# EasyEDA Pro project curtain-lifter.epro, schematic Curtain_Lifter_Mainboard

## Sheets
1 01_Power_Input: Board Name: Curtain_Lifter_Mainboard_RevA; Create Date: 2026-10-13; Page Name: 01_Power_Input; Project Name: 涂鸦智能家居产品-窗帘开关; Schematic Name: Curtain_Lifter_Mainboard; Update Date: 2026-10-13; Company: 嘉立创EDA; Page Size: A4; Version: V1.0
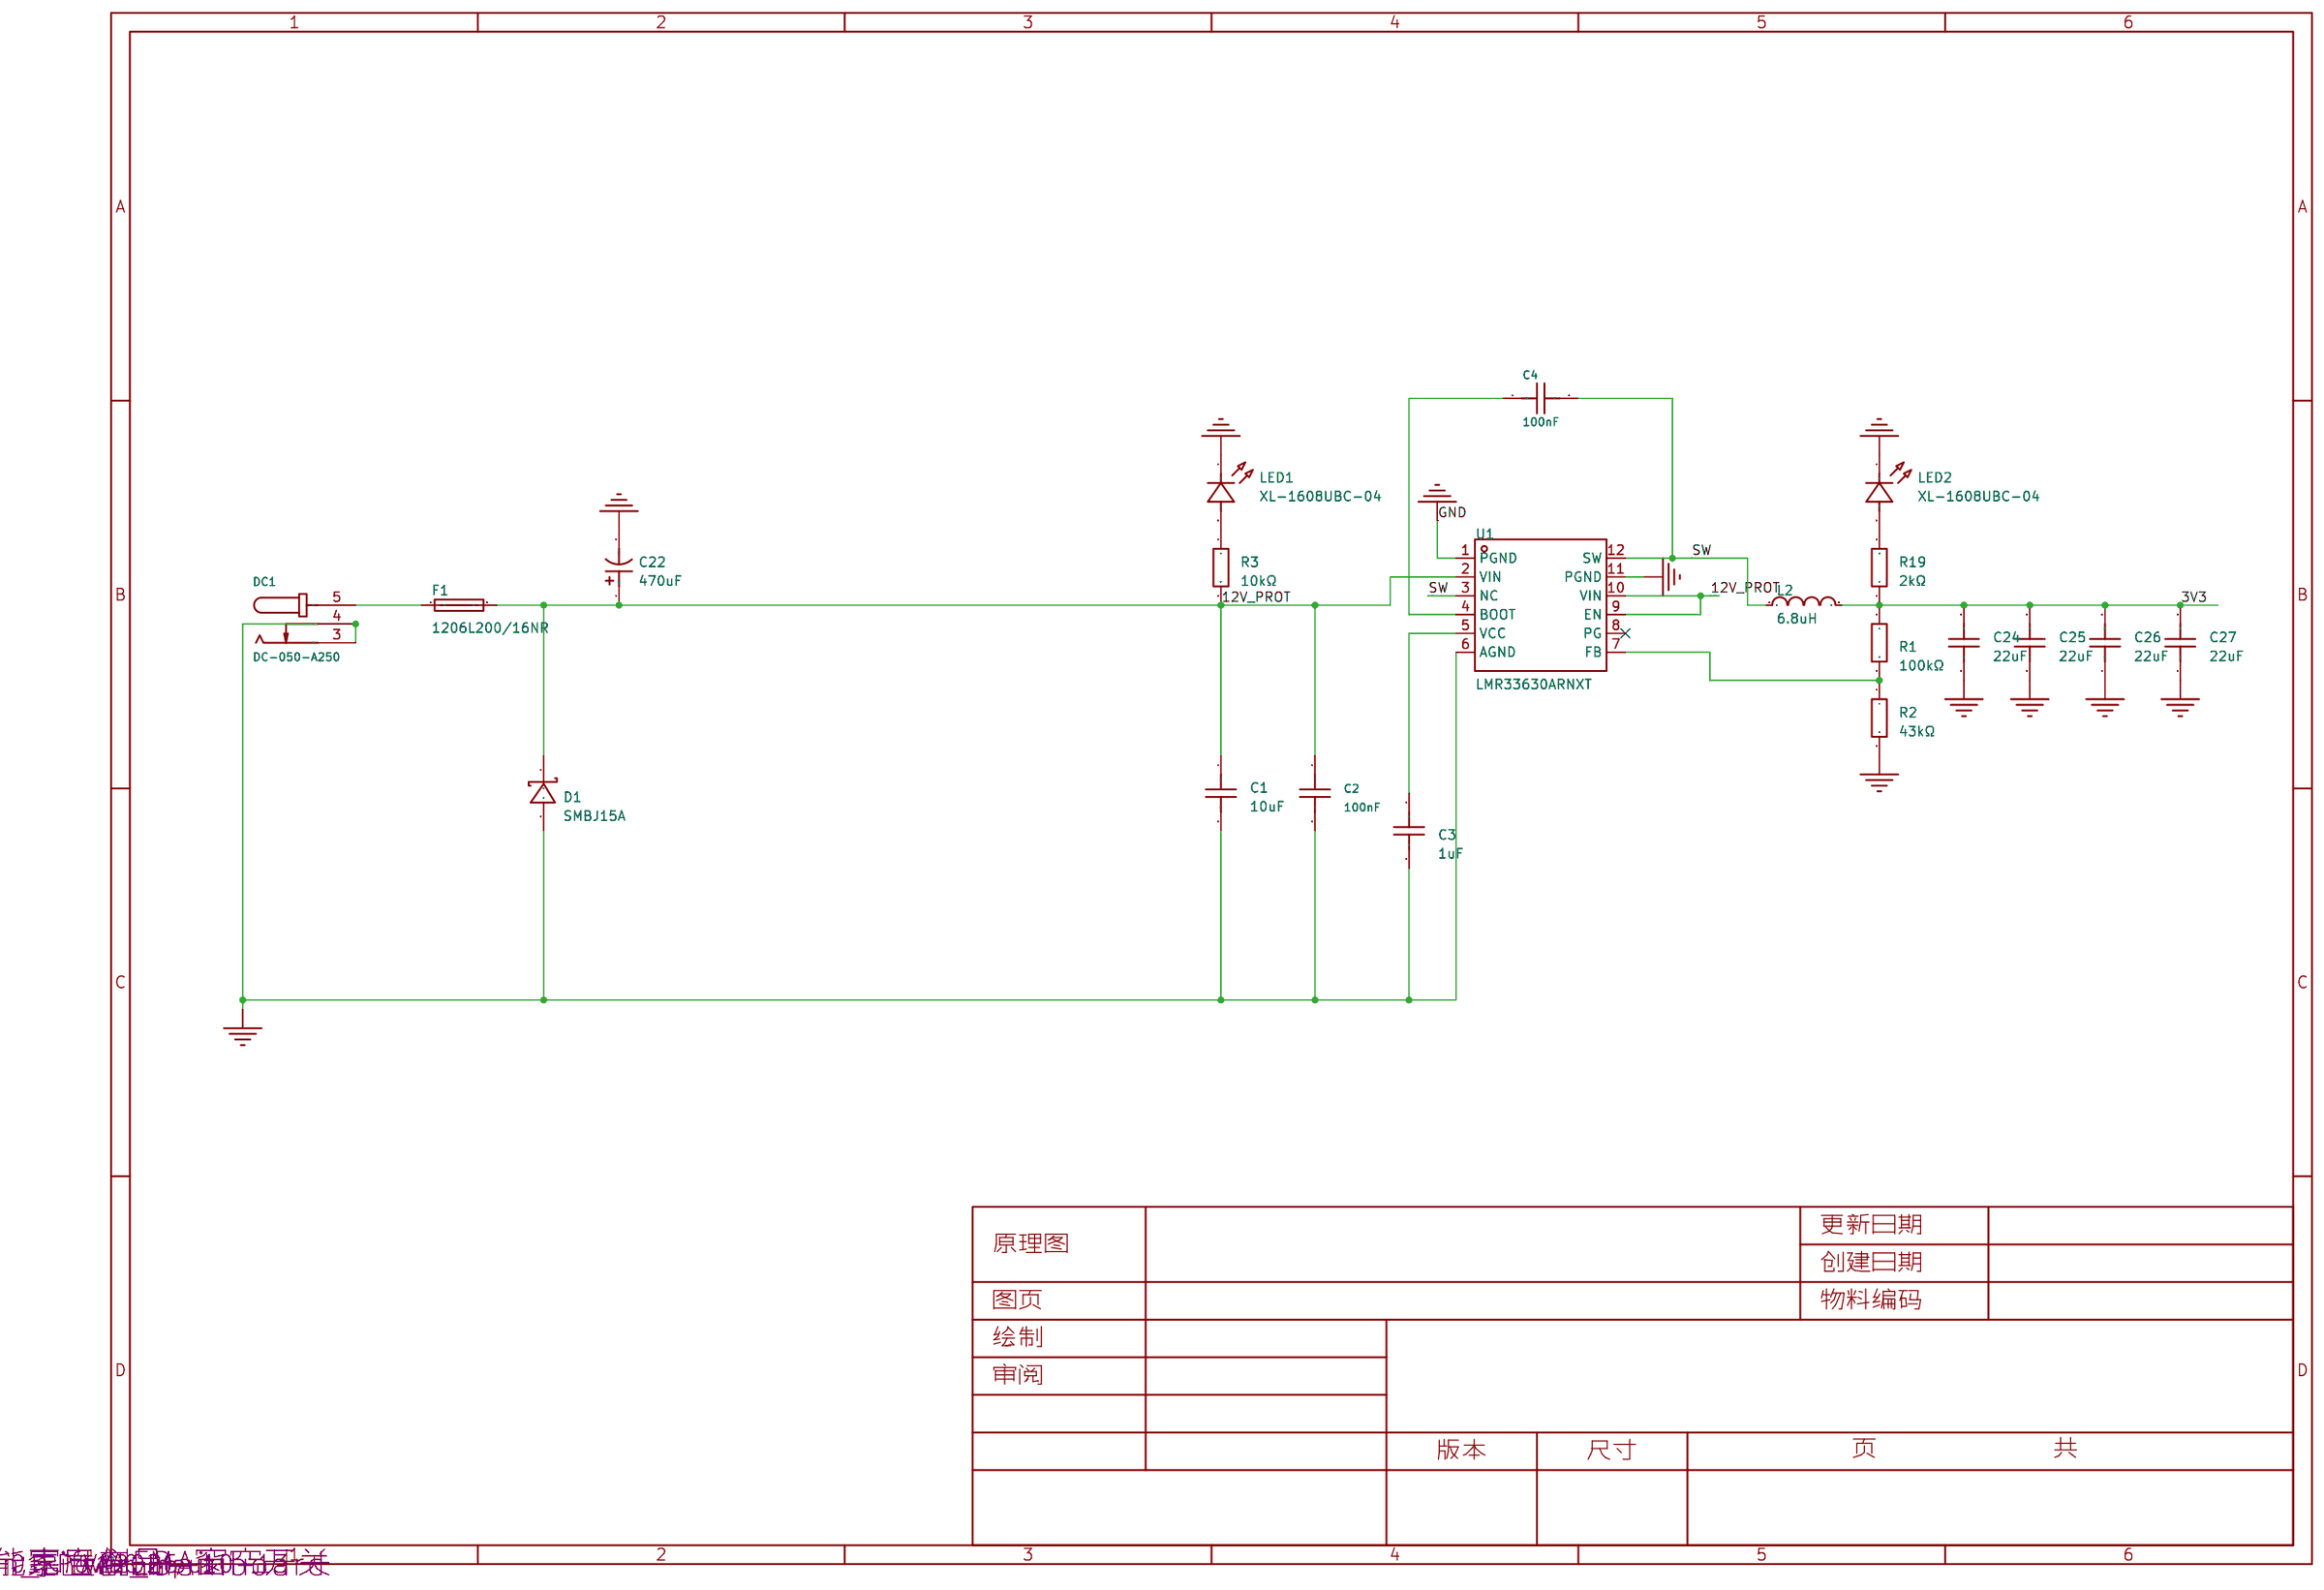
[diagram p1: 01_Power_Input]
2 02_Stepper_Driver: Create Date: 2026-10-25; Page Name: 02_Stepper_Driver; Update Date: 2026-10-25
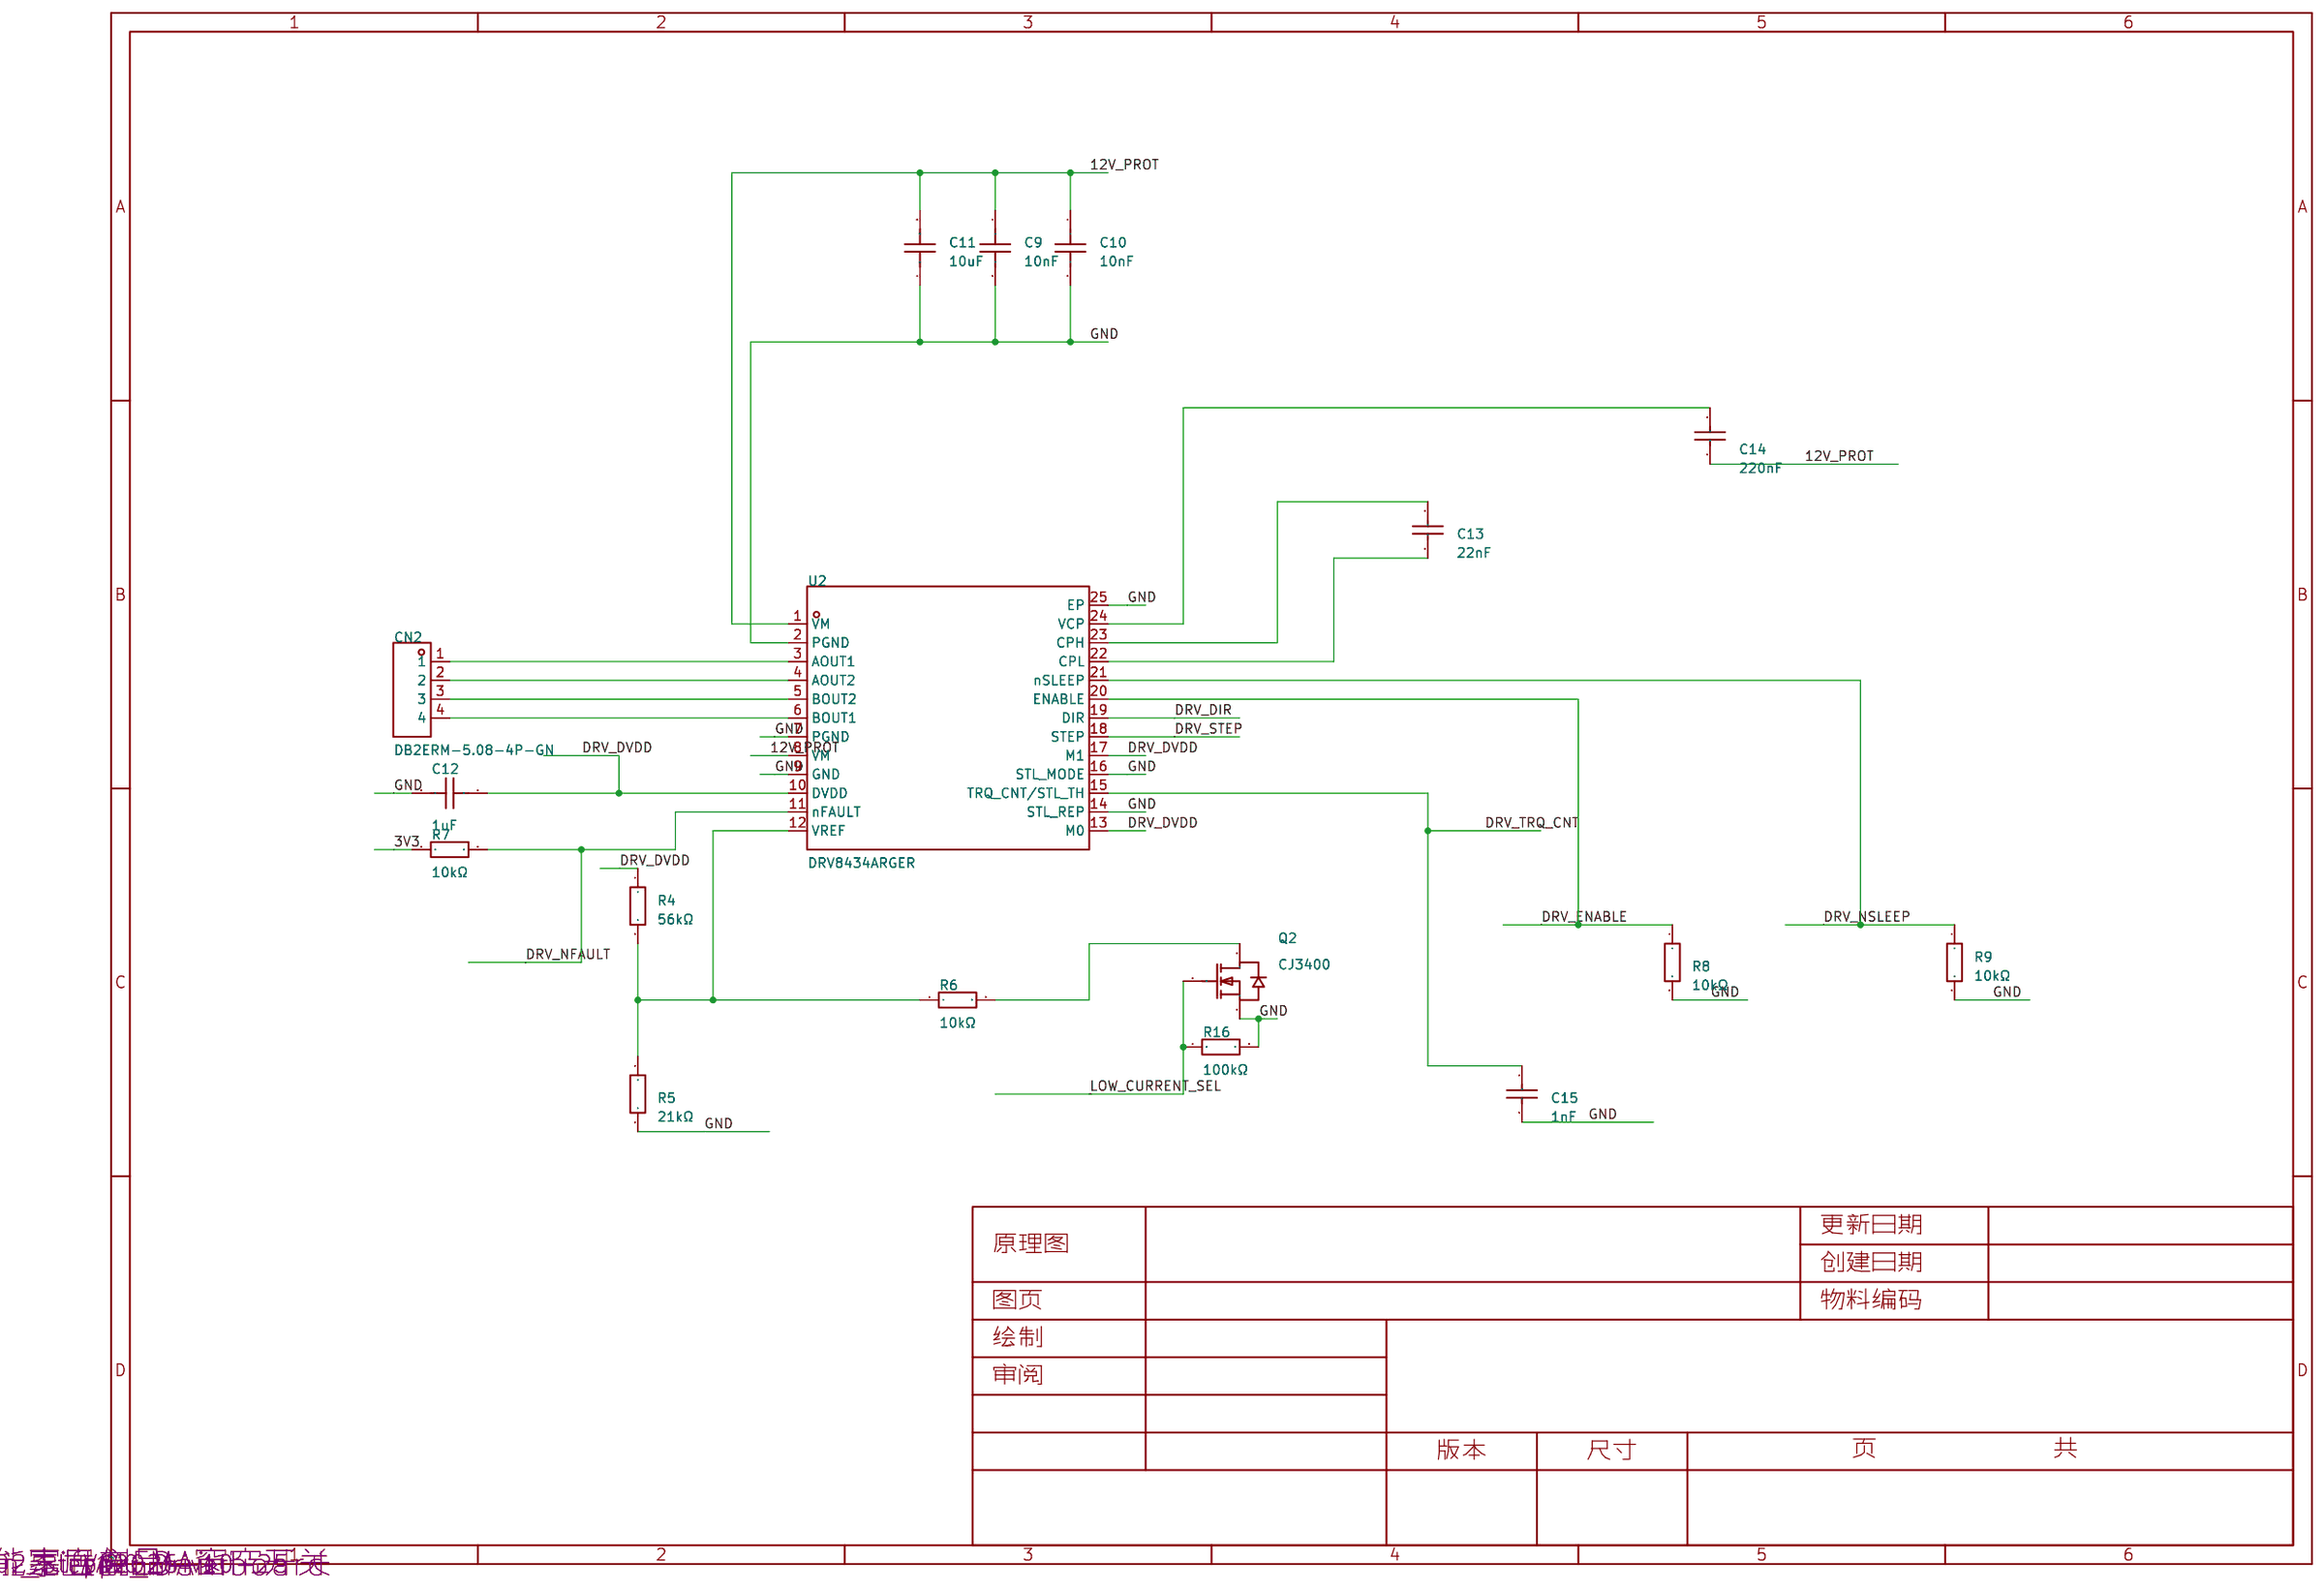
[diagram p2: 02_Stepper_Driver]
3 03_MCU_Control: Page Name: 03_MCU_Control
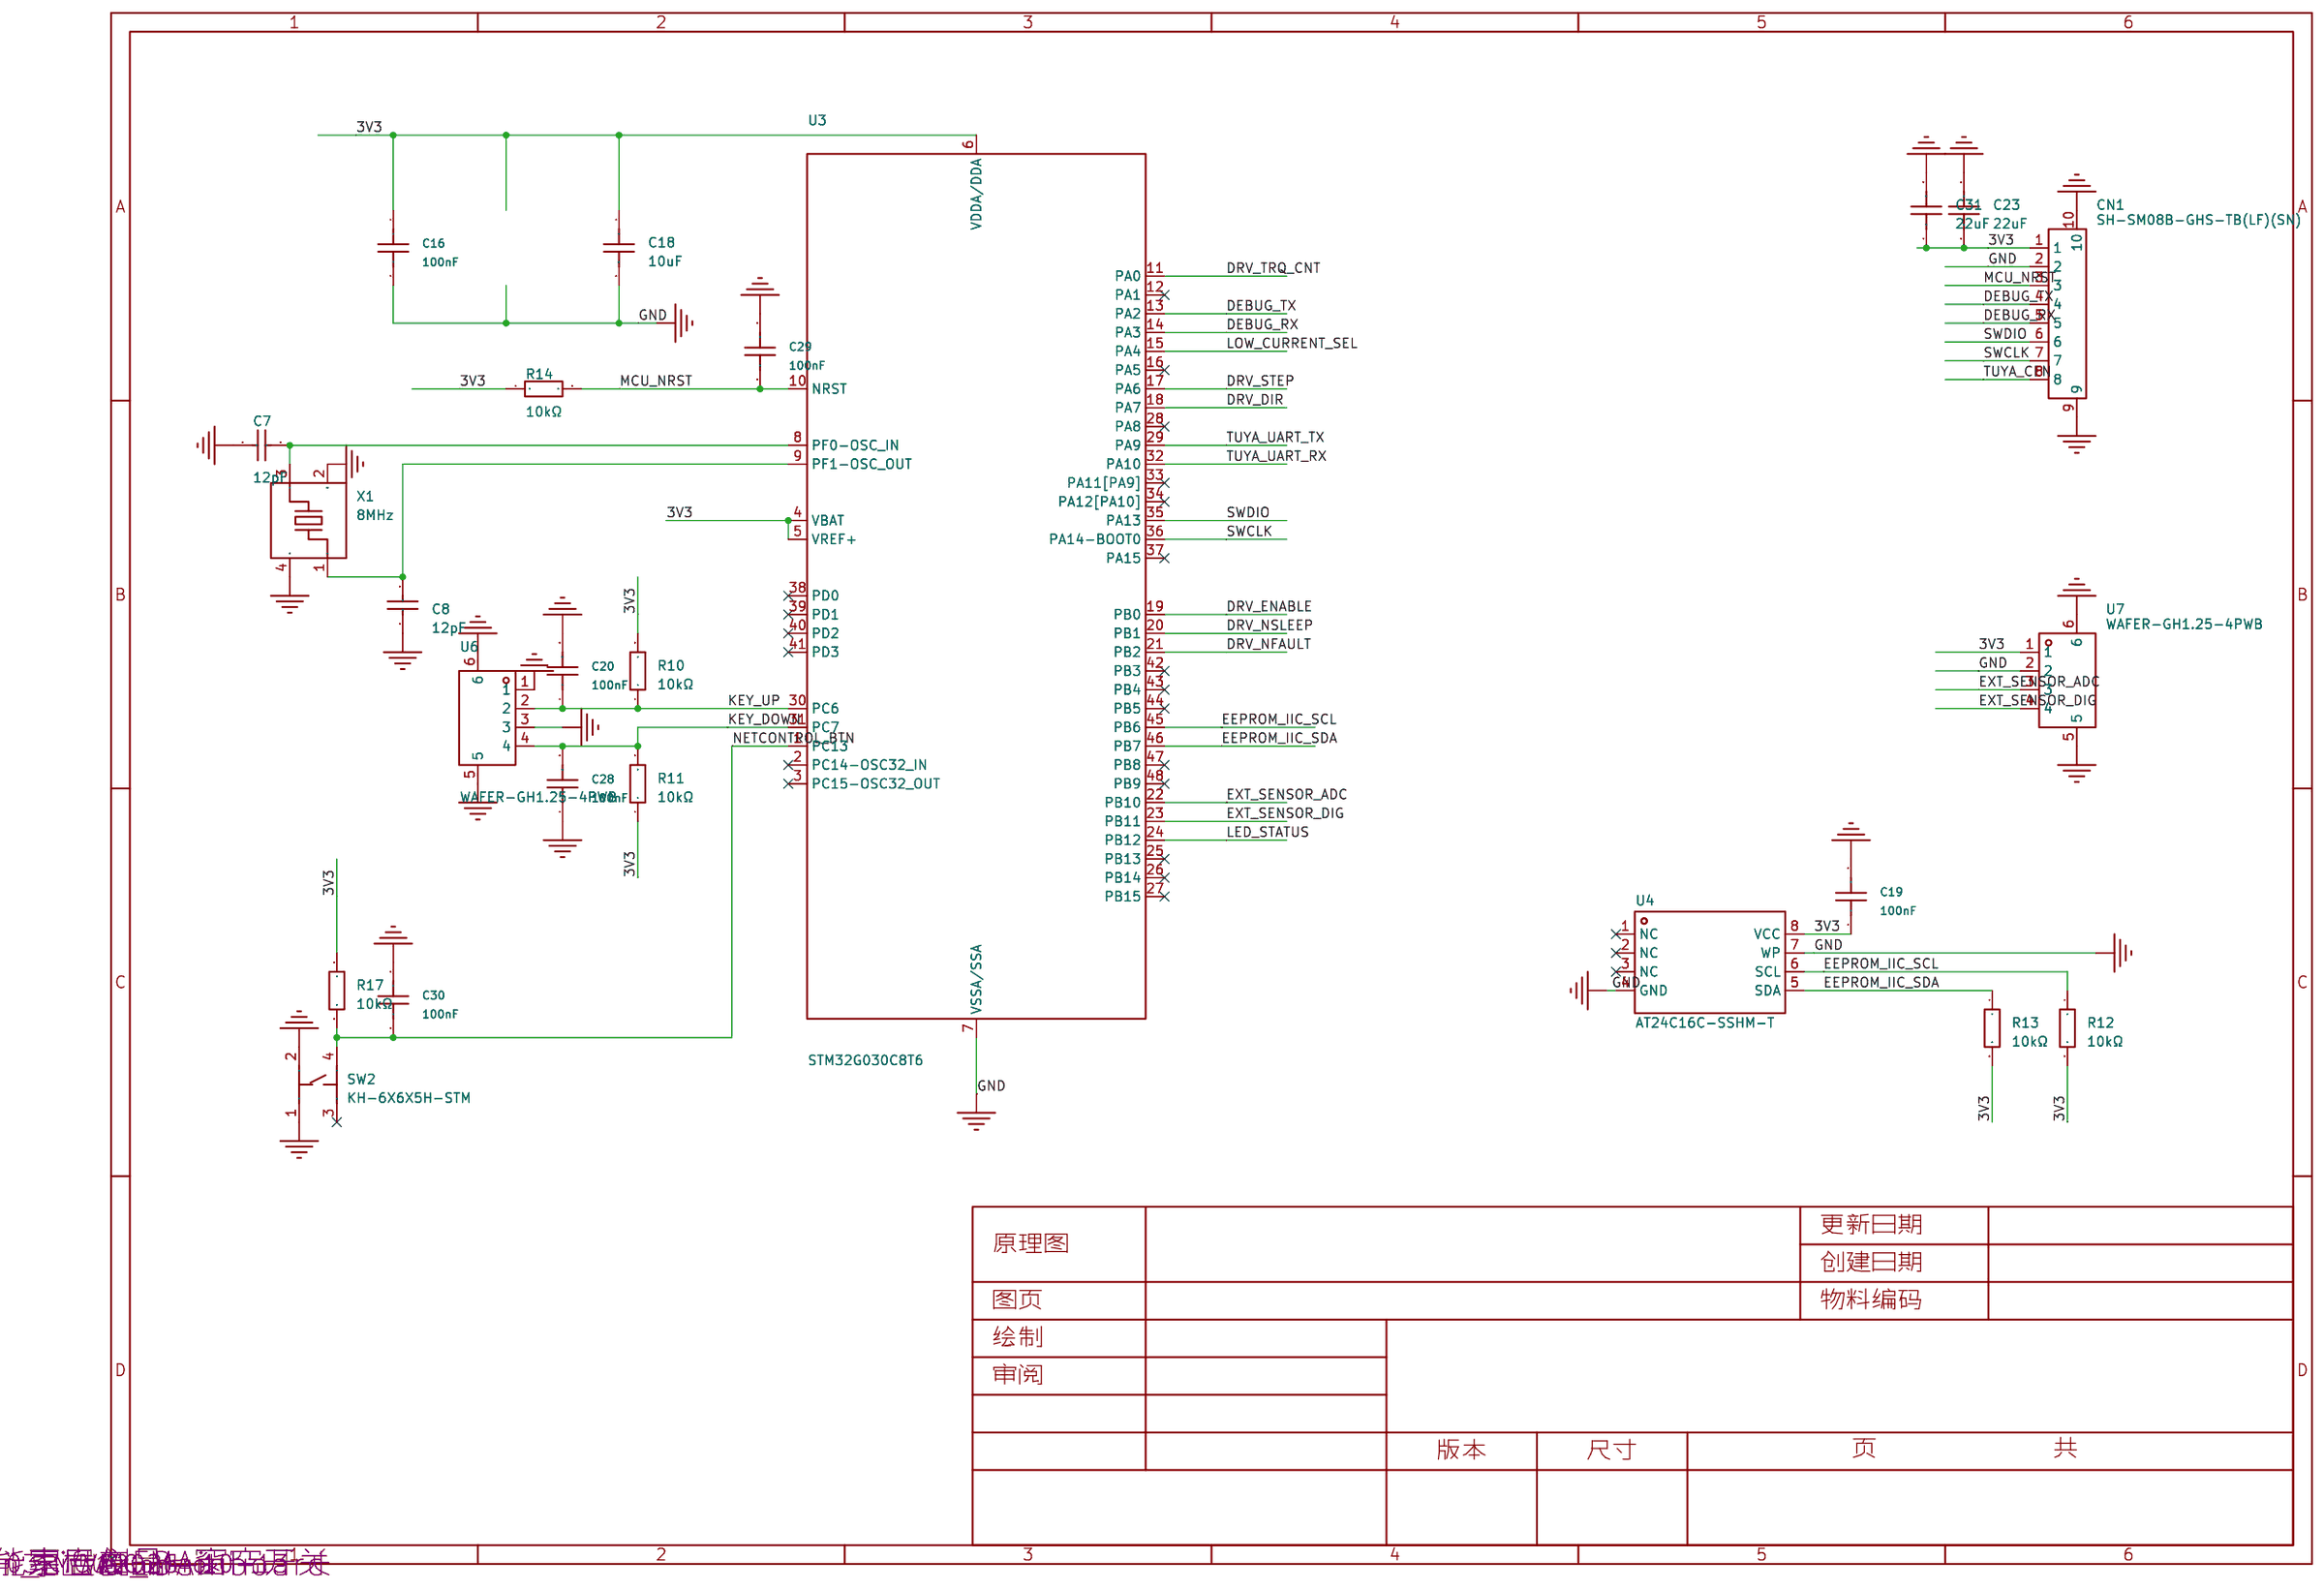
[diagram p3: 03_MCU_Control]
4 04_Wireless_UI: Create Date: 2026-10-25; Page Name: 04_Wireless_UI; Update Date: 2026-10-25
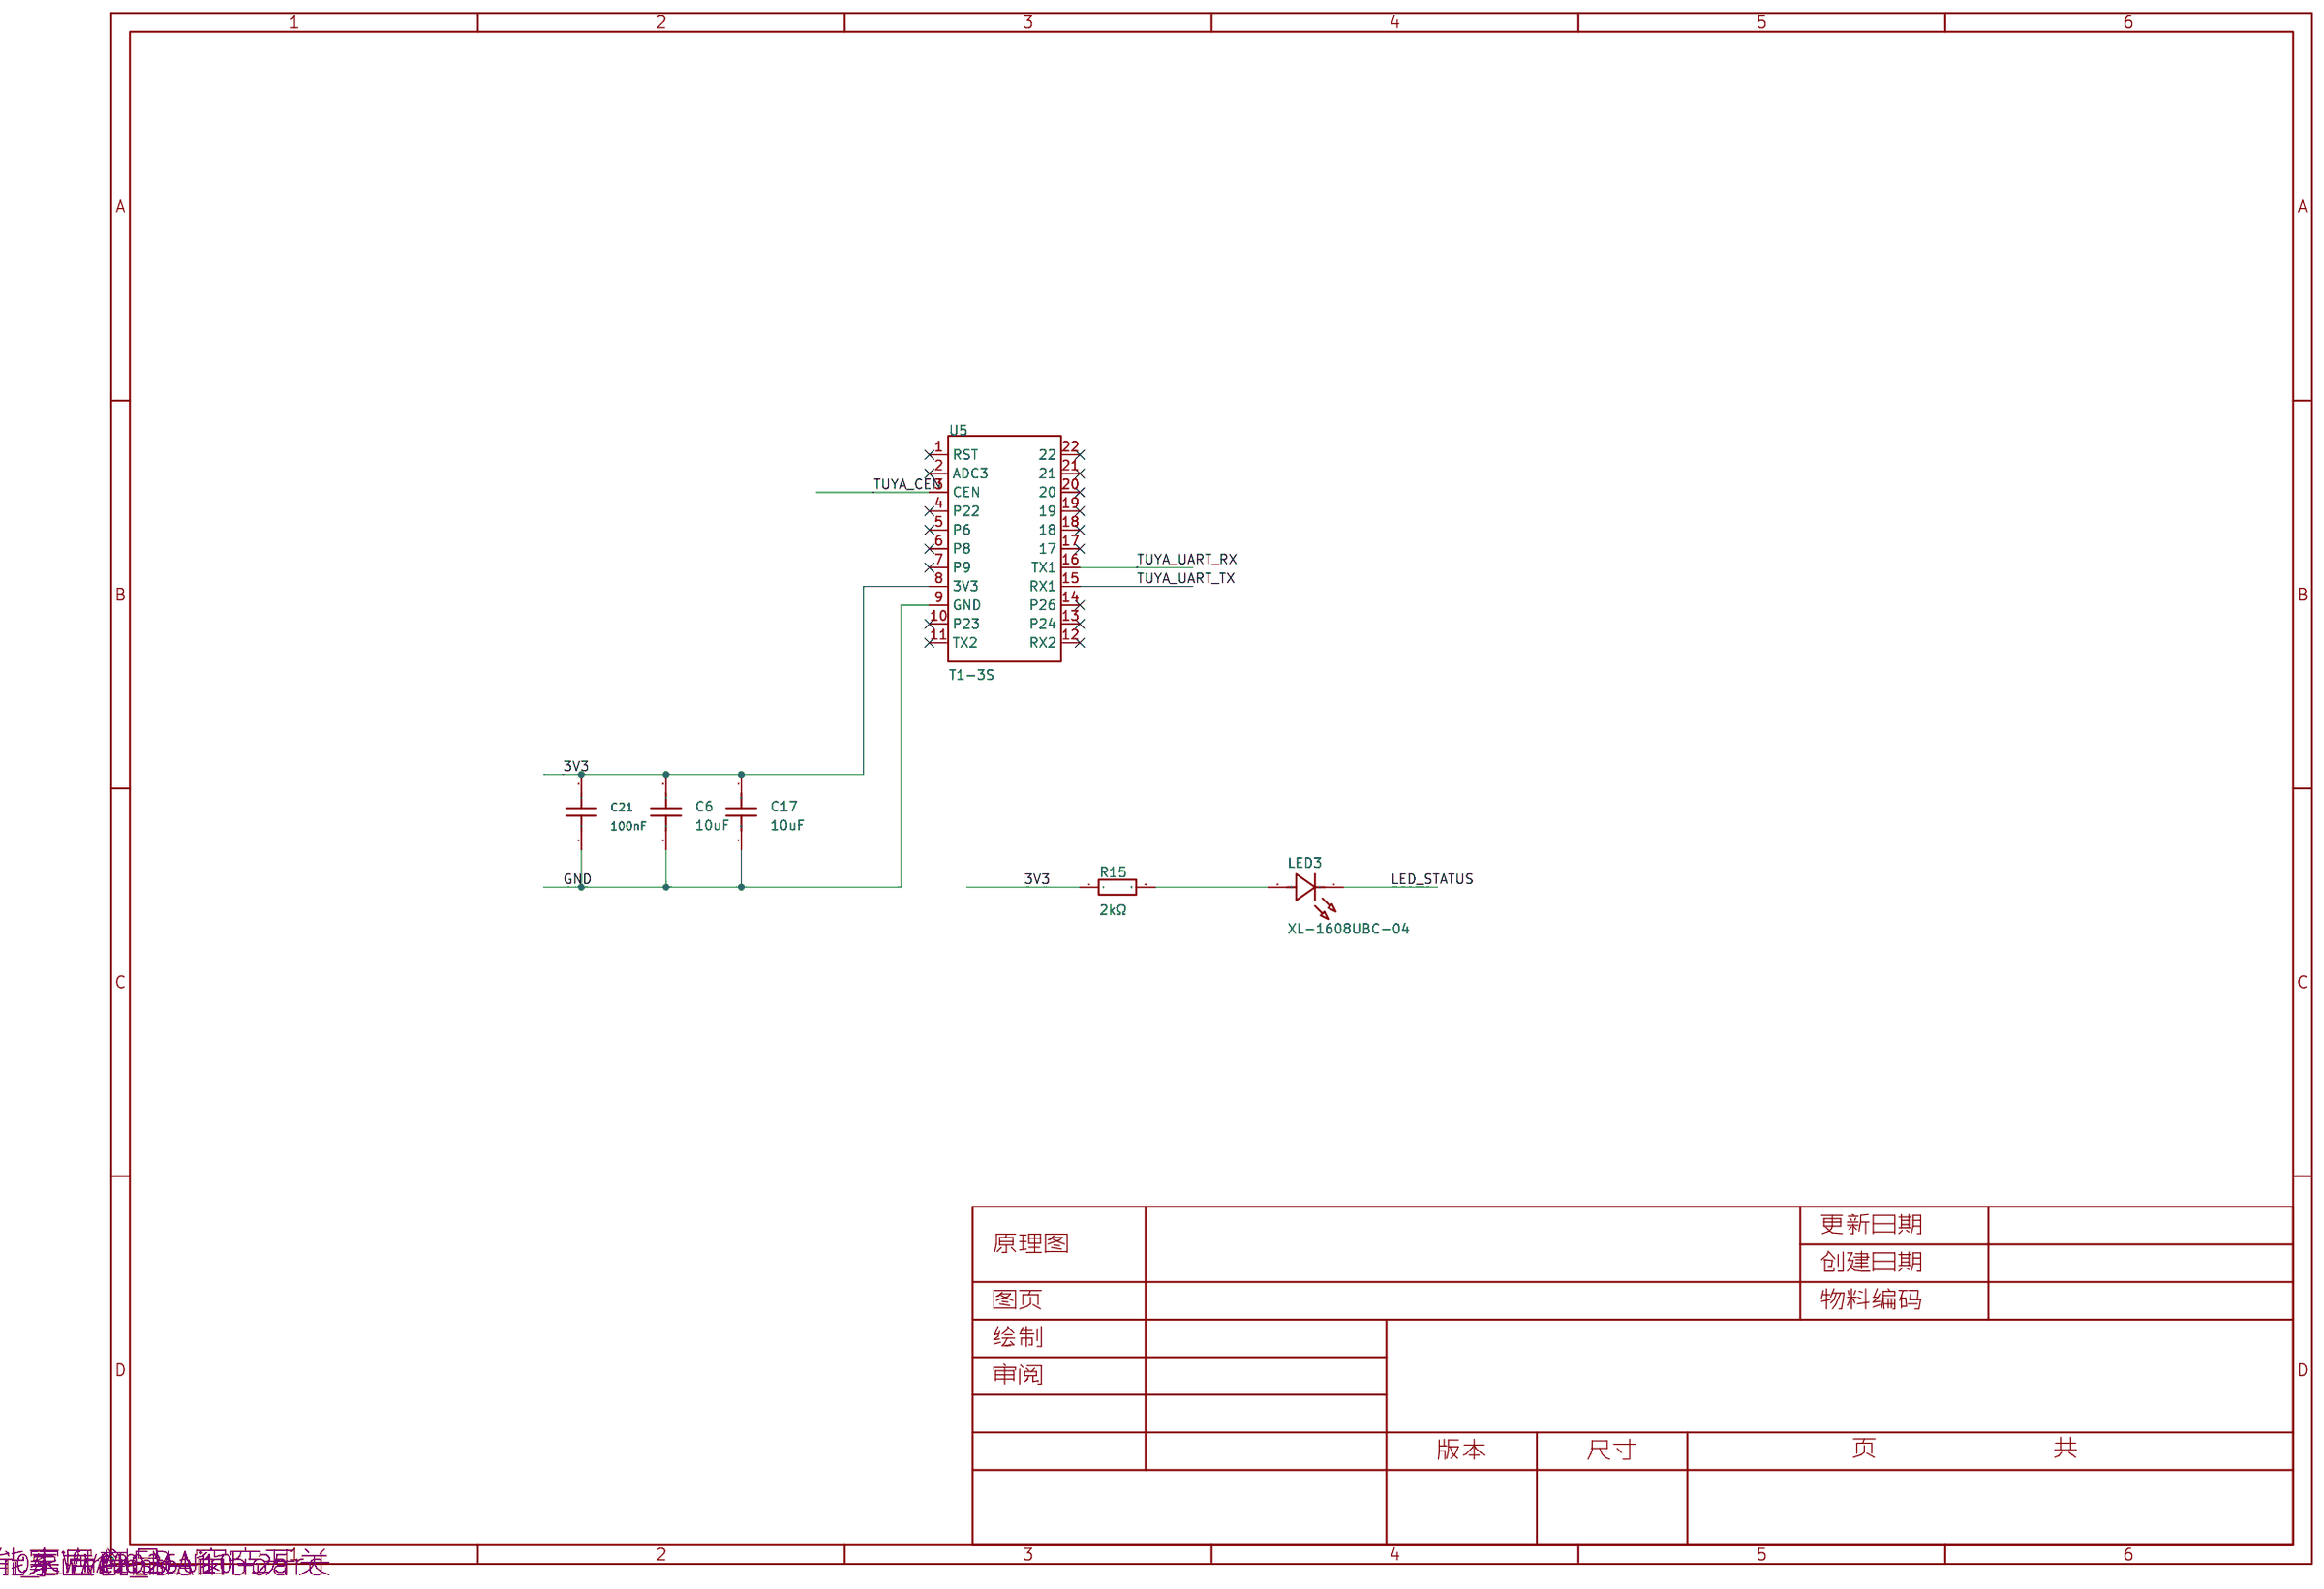
[diagram p4: 04_Wireless_UI]

## Parts
sheet 01_Power_Input
C1  10uF  [C1206]
C2  100nF  [C0603]
C3  1uF  [C0603]
C4  100nF  [C0603]
C22  470uF  [CAP-SMD_BD10.0-L10.3-W10.3-LS11.0]
C24  22uF  [C1206]
C25  22uF  [C1206]
C26  22uF  [C1206]
C27  22uF  [C1206]
D1  SMBJ15A  [SMB_L4.6-W3.6-LS5.3-RD]
DC1  DC-050-A250  [DC-IN-SMD_DC-050-A200]
F1  1206L200/16NR  [F1206]
L2  6.8uH  [IND-SMD_L11.0-W10.0_MDA1054HT]
LED1  XL-1608UBC-04  [LED0603-RD_BLUE]
LED2  XL-1608UBC-04  [LED0603-RD_BLUE]
R1  100kΩ  [R0603]
R2  43kΩ  [R0603]
R3  10kΩ  [R0603]
R19  2kΩ  [R0603]
U1  LMR33630ARNXT  [VQFN-12_L3.0-W2.0-P0.65-BL_TI_LMR33630XRNXT]
sheet 02_Stepper_Driver
C9  10nF  [C0603]
C10  10nF  [C0603]
C11  10uF  [C1206]
C12  1uF  [C0603]
C13  22nF  [C0603]
C14  220nF  [C0603]
C15  1nF  [C0603]
CN2  DB2ERM-5.08-4P-GN  [CONN-TH_4P-P5.08_DB2ERM-5.08-4P]
Q2  CJ3400  [SOT-23_L2.9-W1.3-P1.90-LS2.4-BR]
R4  56kΩ  [R0603]
R5  21kΩ  [R0603]
R6  10kΩ  [R0603]
R7  10kΩ  [R0603]
R8  10kΩ  [R0603]
R9  10kΩ  [R0603]
R16  100kΩ  [R0603]
U2  DRV8434ARGER  [VQFN-24_L4.0-W4.0-P0.50-TL-EP2.5]
sheet 03_MCU_Control
C7  12pF  [C0603]
C8  12pF  [C0603]
C16  100nF  [C0603]
C18  10uF  [C0805]
C19  100nF  [C0603]
C20  100nF  [C0603]
C23  22uF  [C1206]
C28  100nF  [C0603]
C29  100nF  [C0603]
C30  100nF  [C0603]
C31  22uF  [C1206]
CN1  SH-SM08B-GHS-TB(LF)(SN)  [CONN-SMD_SH-SM08B-GHS-TB]
R10  10kΩ  [R0603]
R11  10kΩ  [R0603]
R12  10kΩ  [R0603]
R13  10kΩ  [R0603]
R14  10kΩ  [R0603]
R17  10kΩ  [R0603]
SW2  KH-6X6X5H-STM  [SW-SMD_4P-L6.0-W6.0-P4.50-LS9.0_H5.0]
U3  STM32G030C8T6  [LQFP-48_L7.0-W7.0-P0.50-LS9.0-BL_1]
U4  AT24C16C-SSHM-T  [SOIC-8_L4.9-W3.9-P1.27-LS6.0-BL]
U6  WAFER-GH1.25-4PWB  [CONN-SMD_4P-P1.25_XUNPU_WAFER-GH1.25-4PWB]
U7  WAFER-GH1.25-4PWB  [CONN-SMD_4P-P1.25_XUNPU_WAFER-GH1.25-4PWB]
X1  8MHz  [CRYSTAL-SMD_4P-L3.2-W2.5-BL]
sheet 04_Wireless_UI
C6  10uF  [C0805]
C17  10uF  [C0805]
C21  100nF  [C0603]
LED3  XL-1608UBC-04  [LED0603-RD_BLUE]
R15  2kΩ  [R0603]
U5  T1-3S  [WIFIM-SMD_22P-L24.0-W16.0-P2.00_TI-3S]

## Library data of the parts
C1 C11 = HGC1206R7106K500NSPJ: 容值:10uF;精度:±10%;额定电压:50V;温度系数:X7R;; LCSC Part Name: 10uF ±10% 50V; Supplier Part: C33546013; Manufacturer: Chinocera(华瓷); Supplier Footprint: 1206; JLCPCB Part Class: Extended Part; Datasheet: https://item.szlcsc.com/datasheet/HGC1206R7106K500NSPJ/35278491.html; Supplier: LCSC; Tolerance: ±10%; Voltage Rating: 50V; Temperature Coefficient: X7R
C2 C4 C16 C19-C21 C28-C30 = CC0603KRX7R9BB104: 容值:100nF;精度:±10%;额定电压:50V;温度系数:X7R;; LCSC Part Name: 100nF ±10% 50V; Supplier Part: C14663; Manufacturer: YAGEO(国巨); Supplier Footprint: 0603; JLCPCB Part Class: Basic Part; Datasheet: https://item.szlcsc.com/datasheet/CC0603KRX7R9BB104/15331.html; Supplier: LCSC; Tolerance: ±10%; Voltage Rating: 50V; Temperature Coefficient: X7R; supplier: LCSC; supplierId: C14663
C3 C12 = CL10A105KB8NNNC: 容值:1uF;精度:±10%;额定电压:50V;温度系数:X5R;; LCSC Part Name: 1uF ±10% 50V; Supplier Part: C15849; Manufacturer: SAMSUNG(三星); Supplier Footprint: 0603; JLCPCB Part Class: Basic Part; Datasheet: https://item.szlcsc.com/datasheet/CL10A105KB8NNNC/16531.html; Supplier: LCSC; Tolerance: ±10%; Voltage Rating: 50V; Temperature Coefficient: X5R; supplier: LCSC; supplierId: C15849
C22 = JVJ35V470M10x10: 容值:470uF;精度:±20%;额定电压:35V;纹波电流:320mA@120Hz;; LCSC Part Name: 470uF ±20% 35V; Supplier Part: C46550413; Manufacturer: JIERR(捷而瑞); Supplier Footprint: SMD,D10xL10.5mm; JLCPCB Part Class: Extended Part; Datasheet: https://item.szlcsc.com/datasheet/JVJ35V470M10x10/48680107.html; Supplier: LCSC; Tolerance: ±20%; Voltage Rating: 35V; Ripple Current: 320mA@120Hz; Diameter: 10mm; Height - Seated (Max): 10.5mm; Lifetime: 2000hrs@105℃; Operating Temperature: -55℃~+105℃
C23-C27 C31 = FCC1206X226K160HT: 容值:22uF;精度:±10%;额定电压:16V;温度系数:X5R;; LCSC Part Name: 22uF ±10% 16V; Supplier Part: C5137635; Manufacturer: FOJAN(富捷); Supplier Footprint: 1206; JLCPCB Part Class: Extended Part; Datasheet: https://item.szlcsc.com/datasheet/FCC1206X226K160HT/5747087.html; Supplier: LCSC; Tolerance: ±10%; Voltage Rating: 16V; Temperature Coefficient: X5R; Operating Temperature: -55℃~+85℃
D1 = SMBJ15A: 极性:单向;反向截止电压(Vrwm):15V;钳位电压:24.4V;峰值脉冲电流(Ipp):24.59A;峰值脉冲功率(Ppp):600W@10/1000us;击穿电压(VBR):16.7V;; LCSC Part Name: 单向TVS 15V截止 峰值浪涌电流：24.59A; Supplier Part: C357961; Manufacturer: DOWO(东沃); Supplier Footprint: SMB(DO-214AA); JLCPCB Part Class: Extended Part; Datasheet: https://item.szlcsc.com/datasheet/SMBJ15A/333045.html; Supplier: LCSC; Polarity: 单向; Reverse Stand-Off Voltage (Vrwm): 15V; Clamping Voltage: 24.4V; Peak Pulse Current (Ipp): 24.59A; Peak Pulse Power Dissipation (Ppp): 600W@10/1000us; Voltage - Breakdown: 16.7V; Reverse Leakage Current (Ir): 1uA; Number of Channels: 单路; Operating Temperature: -55℃~+150℃; Type: TVS; supplier: LCSC; supplierId: C357961
DC1 = DC-050-A250: 连接器类型:DC电源插座;安装方式:卧贴;触点内径:2.5mm;触点外径:6.4mm;额定电流:1A;额定电压:12V;工作温度:-30℃~+70℃;; LCSC Part Name: DC电源插座 内径:2.5mm 外径:6.4mm; Supplier Part: C41429013; Manufacturer: XUNPU(讯普); Supplier Footprint: SMD; JLCPCB Part Class: Extended Part; Datasheet: https://item.szlcsc.com/datasheet/DC-050-A250/43280632.html; Supplier: LCSC; Connector Type: DC电源插座; Mounting Type: 卧贴; Inside Contact Diameter: 2.5mm; Outside Contact Diameter: 6.4mm; Current Rating: 1A; Voltage Rating (Max): 12V; Body Height: 11mm; Length: 14.7mm; Width: 12.7mm; Operating Temperature: -30℃~+70℃
F1 = 1206L200/16NR: 耐压(Vmax):16V;最大电流(Imax):40A;保持电流(Ihold):2A;跳闸电流(Itrip):3.5A;; LCSC Part Name: 16V 2A 1206高电压自恢复保险丝; Supplier Part: C22374899; Manufacturer: LUTE(陆特); Supplier Footprint: 1206; JLCPCB Part Class: Extended Part; Datasheet: https://item.szlcsc.com/datasheet/1206L200%252F16NR/23878498.html; Supplier: LCSC; Voltage - Max: 16V; Current - Max: 40A; Hold Current: 2A; Trip Current: 3.5A; Power Dissipation: 1.2W; Resistance - Initial (Ri) (Min): 15mΩ; Resistance - Post Trip (R1) (Max): 80mΩ; Time to Trip(Max): 1.5s; Operating Temperature: -40℃~+85℃; Length: 3.6mm; Width: 1.9mm; Height: 1.6mm; supplier: LCSC; supplierId: C22374899
L2 = MWSA1004S-6R8MT: 电感值:6.8uH;精度:±20%;额定电流:8.5A;饱和电流(Isat):12A;类型:-;; LCSC Part Name: 6.8uH ±20% 12A; Supplier Part: C408485; Manufacturer: Sunlord(顺络); Supplier Footprint: SMD,11x10mm; JLCPCB Part Class: Extended Part; Datasheet: https://atta.szlcsc.com/upload/public/pdf/source/20231024/D9DB0CBBB5804BFBC9233D4A02F4216A.pdf; Supplier: LCSC; Tolerance: ±20%; Rated Current: 8.5A; Saturation Current (Isat): 12A; DC Resistance (DCR): 25mΩ
LED1-LED3 = XL-1608UBC-04: 灯头类型:1.6mmx0.8mm方形灯头;发光颜色:蓝色;正向压降(Vf):3.3V;功率:70mW;正向电流:20mA;波长:455nm~475nm;二极管配置:独立二极管;透镜颜色:无色透明透镜;色温:-;发光强度:300mcd;发光角度:120°;载带方式:正贴;工作温度:-40℃~+85℃;; LCSC Part Name: 0603蓝色贴片式发光二极管; Supplier Part: C965807; Manufacturer: XINGLIGHT(成兴光); Supplier Footprint: 0603; JLCPCB Part Class: Extended Part; Datasheet: https://item.szlcsc.com/datasheet/XL-1608UBC-04/1051416.html; Supplier: LCSC; Lamp Holder Type: 1.6mmx0.8mm方形灯头; Illumination Color: 蓝色; Voltage - Forward(Vf): 3.3V; Power(Watts): 70mW; Forward Current: 20mA; Wavelength - Dominant: 455nm~475nm; Peak Wavelength: 470nm; Diode Configuration: 独立二极管; Lens Color: 无色透明透镜; Luminous Intensity: 300mcd; Viewing Angle: 120°; Mounting Style: 正贴; Operating Temperature: -40℃~+85℃
R1 R16 = 0603WAF1003T5E: 电阻类型:厚膜电阻;阻值:100kΩ;精度:±1%;功率:100mW;工作电压:75V;温度系数:±100ppm/℃;; LCSC Part Name: 厚膜电阻 100kΩ ±1%; Supplier Part: C25803; Manufacturer: UNI-ROYAL(厚声); Supplier Footprint: 0603; JLCPCB Part Class: Basic Part; Datasheet: https://item.szlcsc.com/datasheet/0603WAF1003T5E/26546.html; Supplier: LCSC; Type: 厚膜电阻; Tolerance: ±1%; Power(Watts): 100mW; Voltage-Supply(Max): 75V; Temperature Coefficient: ±100ppm/℃; Operating Temperature: -55℃~+155℃; supplier: LCSC; supplierId: C25803
R2 = 0603WAF4302T5E: 电阻类型:厚膜电阻;阻值:43kΩ;精度:±1%;功率:100mW;工作电压:75V;温度系数:±100ppm/℃;; LCSC Part Name: 厚膜电阻 43kΩ ±1%; Supplier Part: C23172; Manufacturer: UNI-ROYAL(厚声); Supplier Footprint: 0603; JLCPCB Part Class: Extended Part; Datasheet: https://item.szlcsc.com/datasheet/0603WAF4302T5E/23899.html; Supplier: LCSC; Type: 厚膜电阻; Tolerance: ±1%; Power(Watts): 100mW; Voltage-Supply(Max): 75V; Temperature Coefficient: ±100ppm/℃; Operating Temperature: -55℃~+155℃; supplier: LCSC; supplierId: C23172
R3 R6-R14 R17 = 0603WAF1002T5E: 电阻类型:厚膜电阻;阻值:10kΩ;精度:±1%;功率:100mW;工作电压:75V;温度系数:±100ppm/℃;; LCSC Part Name: 厚膜电阻 10kΩ ±1% 100mW; Supplier Part: C25804; Manufacturer: UNI-ROYAL(厚声); Supplier Footprint: 0603; JLCPCB Part Class: Basic Part; Datasheet: https://item.szlcsc.com/datasheet/0603WAF1002T5E/26547.html; Supplier: LCSC; Type: 厚膜电阻; Tolerance: ±1%; Power(Watts): 100mW; Voltage-Supply(Max): 75V; Temperature Coefficient: ±100ppm/℃; Operating Temperature: -55℃~+155℃; supplier: LCSC; supplierId: C25804
R15 R19 = 0603WAF2001T5E: 电阻类型:厚膜电阻;阻值:2kΩ;精度:±1%;功率:100mW;工作电压:75V;温度系数:±100ppm/℃;; LCSC Part Name: 厚膜电阻 2kΩ ±1%; Supplier Part: C22975; Manufacturer: UNI-ROYAL(厚声); Supplier Footprint: 0603; JLCPCB Part Class: Basic Part; Datasheet: https://item.szlcsc.com/datasheet/0603WAF2001T5E/23702.html; Supplier: LCSC; Type: 厚膜电阻; Tolerance: ±1%; Power(Watts): 100mW; Voltage-Supply(Max): 75V; Temperature Coefficient: ±100ppm/℃; Operating Temperature: -55℃~+155℃
U1 = LMR33630ARNXT: 功能类型:降压型;工作电压:3.8V~36V;输出电压:1V~24V;输出电流:3A;输出类型:可调;; LCSC Part Name: 降压型 3A 3.8V~36V; Supplier Part: C2071058; Manufacturer: TI(德州仪器); Supplier Footprint: VQFN-12(2x3); JLCPCB Part Class: Extended Part; Datasheet: https://www.ti.com/cn/lit/gpn/lmr33630; Supplier: LCSC; Function: 降压型; Voltage - Supply: 3.8V~36V; Output Voltage: 1V~24V; Output Current: 3A; Frequency - Switching: 400kHz; Operating Temperature: -40℃~+125℃@(TJ); Synchronous Rectifier: 是; Number of Outputs: 1; Topology: 降压式; Quiescent Current: 25uA; Switch tube (built-in/external): 内置; Output Type: 可调; Features: 轻载高效模式；内置LDO稳压器；逐波限流；过流保护；工作状态指示；打嗝限流; supplier: LCSC; supplierId: C2071058
C9 C10 = CL10B103KB8NNNL: 容值:10nF;精度:±10%;额定电压:50V;温度系数:X7R;; LCSC Part Name: 10nF ±10% 50V; Supplier Part: C16194318; Manufacturer: SAMSUNG(三星); Supplier Footprint: 0603; JLCPCB Part Class: Extended Part; Datasheet: https://item.szlcsc.com/datasheet/CL10B103KB8NNNL/17319394.html; Supplier: LCSC; Tolerance: ±10%; Voltage Rating: 50V; Temperature Coefficient: X7R; supplier: LCSC; supplierId: C16194318
C13 = CL10B223KB8NNNC: 容值:22nF;精度:±10%;额定电压:50V;温度系数:X7R;; LCSC Part Name: 22nF ±10% 50V; Supplier Part: C21122; Manufacturer: SAMSUNG(三星); Supplier Footprint: 0603; JLCPCB Part Class: Basic Part; Datasheet: https://item.szlcsc.com/datasheet/CL10B223KB8NNNC/21834.html; Supplier: LCSC; Tolerance: ±10%; Voltage Rating: 50V; Temperature Coefficient: X7R; supplier: LCSC; supplierId: C21122
C14 = CL10B224KA8NNNC: 容值:220nF;精度:±10%;额定电压:25V;温度系数:X7R;; LCSC Part Name: 220nF ±10% 25V; Supplier Part: C21120; Manufacturer: SAMSUNG(三星); Supplier Footprint: 0603; JLCPCB Part Class: Basic Part; Datasheet: https://item.szlcsc.com/datasheet/CL10B224KA8NNNC/21832.html; Supplier: LCSC; Tolerance: ±10%; Voltage Rating: 25V; Temperature Coefficient: X7R; supplier: LCSC; supplierId: C21120
C15 = CL10B102KB8NNNC: 容值:1nF;精度:±10%;额定电压:50V;温度系数:X7R;; LCSC Part Name: 1nF ±10% 50V; Supplier Part: C1588; Manufacturer: SAMSUNG(三星); Supplier Footprint: 0603; JLCPCB Part Class: Basic Part; Datasheet: https://item.szlcsc.com/datasheet/CL10B102KB8NNNC/1940.html; Supplier: LCSC; Tolerance: ±10%; Voltage Rating: 50V; Temperature Coefficient: X7R; Operating Temperature: -55℃~+125℃; supplier: LCSC; supplierId: C1588
CN2 = DB2ERM-5.08-4P-GN: 连接器类型:板端/插座-闭口;固定方式:螺丝固定;结构:1x4P;间距:5.08mm;颜色:绿色;安装方式:弯插;排数:1;每排PIN数:4;额定电流:15A;额定电压:630V;线规 - AWG:-;线规 - 平方毫米:-;工作温度:-40℃~+105℃;; LCSC Part Name: 螺丝固定 1x4P 5.08mm 排数:1 每排P数:4; Supplier Part: C395755; Manufacturer: DORABO(地博电气); Supplier Footprint: 弯插,P=5.08mm; JLCPCB Part Class: Extended Part; Datasheet: https://item.szlcsc.com/datasheet/DB2ERM-5.08-4P-GN/376502.html; Supplier: LCSC; Connector Type: 板端/插座-闭口; Termination Style: 螺丝固定; Number of Positions or Pins: 1x4P; Pitch: 5.08mm; Color: 绿色; Mounting Type: 弯插; Number of Pins: 4P; Number of Rows: 1; Number of PINs Per Row: 4; Current Rating: 15A; Voltage Rating (Max): 630V; Operating Temperature: -40℃~+105℃
Q2 = CJ3400: 数量:1个N沟道;漏源电压(Vdss):30V;连续漏极电流(Id):5.8A;导通电阻(RDS(on)):52mΩ@2.5V;耗散功率(Pd):350mW;阈值电压(Vgs(th)):1.4V;; LCSC Part Name: 1个N沟道 耐压:30V 电流:5.8A; Supplier Part: C19019; Manufacturer: CJ(江苏长电/长晶); Supplier Footprint: SOT-23; JLCPCB Part Class: Extended Part; Datasheet: https://item.szlcsc.com/datasheet/CJ3400/19722.html; Supplier: LCSC; Number: 1个N沟道; Drain to Source Voltage: 30V; Current - Continuous Drain(Id): 5.8A; RDS(on): 52mΩ@2.5V; Pd - Power Dissipation: 350mW; Gate Threshold Voltage (Vgs(th)): 1.4V; Input Capacitance(Ciss): 1.05nF; Reverse Transfer Capacitance (Crss@Vds): 77pF; Type: N沟道; Output Capacitance(Coss): 66pF; Vgs: ±12V; supplier: LCSC; supplierId: C19019
R4 = 0603WAF5602T5E: 电阻类型:厚膜电阻;阻值:56kΩ;精度:±1%;功率:100mW;工作电压:75V;温度系数:±100ppm/℃;; LCSC Part Name: 56kΩ ±1% 100mW 厚膜电阻; Supplier Part: C23206; Manufacturer: UNI-ROYAL(厚声); Supplier Footprint: 0603; JLCPCB Part Class: Basic Part; Datasheet: https://item.szlcsc.com/datasheet/0603WAF5602T5E/23933.html; Supplier: LCSC; Type: 厚膜电阻; Tolerance: ±1%; Power(Watts): 100mW; Voltage-Supply(Max): 75V; Temperature Coefficient: ±100ppm/℃; Operating Temperature: -55℃~+155℃; supplier: LCSC; supplierId: C23206
R5 = 0603WAF2102T5E: 电阻类型:厚膜电阻;阻值:21kΩ;精度:±1%;功率:100mW;工作电压:75V;温度系数:±100ppm/℃;; LCSC Part Name: 21kΩ ±1% 100mW 厚膜电阻; Supplier Part: C22956; Manufacturer: UNI-ROYAL(厚声); Supplier Footprint: 0603; JLCPCB Part Class: Extended Part; Datasheet: https://item.szlcsc.com/datasheet/0603WAF2102T5E/23683.html; Supplier: LCSC; Type: 厚膜电阻; Tolerance: ±1%; Power(Watts): 100mW; Voltage-Supply(Max): 75V; Temperature Coefficient: ±100ppm/℃; Operating Temperature: -55℃~+155℃; supplier: LCSC; supplierId: C22956
U2 = DRV8434ARGER: DRV8434A 具有集成式电流检测和失速检测功能的 48V、2.5A 双极步进电机驱动器（使用 GPIO 引脚）; LCSC Part Name: 具有集成电流检测、1/256微步进、智能调优和使用GPIO引脚进行失速检测的步进电机驱动器; Supplier Part: C2866434; Manufacturer: TI(德州仪器); Supplier Footprint: VQFN-24-EP(4x4); JLCPCB Part Class: Extended Part; Datasheet: https://www.ti.com/cn/lit/ds/symlink/drv8434a.pdf; Supplier: LCSC; Motor Drive Voltage(Vm): 4.5V~48V; Output Current: 2.5A; Number of H-bridges: 2; Drive Type: 双极驱动; Step Resolution: 8；64；128；1；4；2；32；256；16; Interface: STEP/DIR; Technology: 是; RDS(on): 330mΩ; Operating Temperature: -40℃~+125℃; Features: 内置电荷泵；过流保护；防止电机失步功能；过温保护；欠压锁定; supplier: LCSC; supplierId: C2866434
C7 C8 = CC0603JRNPO9BN120: 容值:12pF;精度:±5%;额定电压:50V;温度系数:NP0;; LCSC Part Name: 12pF ±5% 50V; Supplier Part: C107034; Manufacturer: YAGEO(国巨); Supplier Footprint: 0603; JLCPCB Part Class: Extended Part; Datasheet: https://item.szlcsc.com/datasheet/CC0603JRNPO9BN120/108250.html; Supplier: LCSC; Tolerance: ±5%; Voltage Rating: 50V; Temperature Coefficient: NP0
C6 C17 C18 = CL21A106KAYNNNE_C15850: 容值:10uF;精度:±10%;额定电压:25V;温度系数:X5R;; LCSC Part Name: 10uF ±10% 25V; Supplier Part: C15850; Manufacturer: SAMSUNG(三星); Manufacturer Part: CL21A106KAYNNNE; Supplier Footprint: 0805; JLCPCB Part Class: Basic Part; Datasheet: https://item.szlcsc.com/datasheet/CL21A106KAYNNNE/16532.html; Supplier: LCSC; Tolerance: ±10%; Voltage Rating: 25V; Temperature Coefficient: X5R; supplier: LCSC; supplierId: C15850
CN1 = SH-SM08B-GHS-TB(LF)(SN): 插针结构:1x8P;间距:1.25mm;安装方式:卧贴;参考系列:GH;总PIN数:8P;排数:1;每排PIN数:8;行距:-;额定电流:1A;触头材质:磷青铜;触头镀层:锡;工作温度:-25℃~+85℃;; LCSC Part Name: 米色 1x8P 间距:1.25mm 卧贴 系列:GH; Supplier Part: C42376901; Manufacturer: SHOU HAN(首韩); Supplier Footprint: SMD,P=1.25mm,卧贴; JLCPCB Part Class: Extended Part; Datasheet: https://item.szlcsc.com/datasheet/SH-SM08B-GHS-TB(LF)(SN)/44272941.html; Supplier: LCSC; Pins Structure: 1x8P; Pitch: 1.25mm; Mounting Type: 卧贴; Reference Series: GH; Number of Pins: 8P; Number of Rows: 1; Number of PINs Per Row: 8; Current Rating: 1A; Contact Material: 磷青铜; Contact Plating: 锡; Operating Temperature: -25℃~+85℃; Voltage Rating: 125V; Plastic Material: LCP; Flame Retardant Rating: UL94V-0; Color: 米色
SW2 = KH-6X6X5H-STM: 电路结构:单刀单掷;按钮形状:圆形按钮;安装方式:立贴;开关长度:6mm;开关宽度:6mm;开关高度:5mm;带支架:不带支架;触点电流:50mA;额定电压:12V;工作寿命:8万次;; LCSC Part Name: 6*6*5mm 立贴 轻触开关; Supplier Part: C2837531; Manufacturer: kinghelm(金航标); Supplier Footprint: SMD-4P,6x6mm; JLCPCB Part Class: Extended Part; Datasheet: https://item.szlcsc.com/datasheet/KH-6X6X5H-STM/3009601.html; Supplier: LCSC; Circuit: 单刀单掷; Actuator Style: 圆形按钮; Mounting Type: 立贴; Length: 6mm; Width: 6mm; Switch Height: 5mm; with Bracket: 不带支架; Contact Current: 50mA; Voltage Rating: 12V; Actuator/Cap Color: 黑色; Termination Style: 鸥翼型; Life: 8万次
U3 = STM32G030C8T6: CPU内核:ARM Cortex-M0+;CPU最大主频:64MHz;CPU位数:32 Bit;; LCSC Part Name: 主流超值系列Arm Cortex-M0+ MCU，具有64 KB Flash存储器、8 KB RAM、64 MHz CPU、2x USART、定时器、ADC和通信接口，2-3.6V; Supplier Part: C529329; Manufacturer: ST(意法半导体); Supplier Footprint: LQFP-48(7x7); JLCPCB Part Class: Extended Part; Datasheet: https://item.szlcsc.com/datasheet/STM32G030C8T6/549607.html; Supplier: LCSC; CPU Core: ARM Cortex-M0+; CPU Maximum Speed: 64MHz; Core Size: 32 Bit; Program Storage Size: 64KB; Program Memory Type: FLASH; RAM Size: 8KB; Number of I/O: 44; ADC (Bit): 12bit; Oscillator Type: 内置+外置; Voltage - Supply: 2V~3.6V; Operating Temperature: -40℃~+85℃; supplier: LCSC; supplierId: C529329
U4 = AT24C16C-SSHM-T: 接口类型:I2C;存储容量:16Kbit;时钟频率(fc):1MHz;; LCSC Part Name: 兼容I²C（两线制）的串行EEPROM; Supplier Part: C6480; Manufacturer: MICROCHIP(美国微芯); Supplier Footprint: SOIC-8; JLCPCB Part Class: Extended Part; Datasheet: https://item.szlcsc.com/datasheet/AT24C16C-SSHM-T/6945.html; Supplier: LCSC; Interface: I2C; Memory Size: 16Kbit; Clock Frequency: 1MHz; Write Cycle Time(Tw): 5ms; Data Retention - TDR (Year): 100年; Write Cycle Endurance: 100万次; Features: 硬件写保护功能；噪声抑制功能; Voltage - Supply: 1.7V~5.5V; Operating Temperature: -40℃~+85℃; Operating Current: 3mA; Standby Current: 6uA; Access Time: 0.9us
U6 U7 = WAFER-GH1.25-4PWB: 插针结构:1x4P;间距:1.25mm;安装方式:卧贴;参考系列:GH;总PIN数:4P;排数:1;每排PIN数:4;行距:-;额定电流:1A;触头材质:黄铜;触头镀层:锡;工作温度:-25℃~+85℃;; LCSC Part Name: 1x4P 间距:1.25mm 卧贴 系列:GH; Supplier Part: C3029379; Manufacturer: XUNPU(讯普); Supplier Footprint: SMD,P=1.25mm,卧贴; JLCPCB Part Class: Extended Part; Datasheet: https://item.szlcsc.com/datasheet/WAFER-GH1.25-4PWB/3561391.html; Supplier: LCSC; Pins Structure: 1x4P; Pitch: 1.25mm; Mounting Type: 卧贴; Reference Series: GH; Number of Pins: 4P; Number of Rows: 1; Number of PINs Per Row: 4; Current Rating: 1A; Contact Material: 黄铜; Contact Plating: 锡; Operating Temperature: -25℃~+85℃; Voltage Rating: 125V; Plastic Material: LCP; Supplementary Features: 辅助焊脚; Color: 米色; Z-Height of the Board: 4.35mm; X-Length of Bottom Edge on Board (Spacing Line): 8.25mm; Y-Width of Bottom Edge on Board: 5mm
X1 = X32258MOB4SI: 晶振类型:贴片晶振;频率:8MHz;常温频差:±10ppm;负载电容:12pF;频率稳定度:±20ppm;; LCSC Part Name: YSX321SL 8MHZ 4P 3225 12PF ±10PPM -40~85℃ (±20PPM); Supplier Part: C2682775; Manufacturer: YXC(扬兴晶振); Supplier Footprint: SMD3225-4P; JLCPCB Part Class: Extended Part; Datasheet: https://item.szlcsc.com/datasheet/X32258MOB4SI/2777872.html; Supplier: LCSC; Type: 贴片晶振; Normal temperature Frequency Tolerance: ±10ppm; Load Capacitance: 12pF; Frequency Stability: ±20ppm; Equivalent Series Resistance(ESR): 180Ω; Operating Temperature: -40℃~+85℃
U5 = T1-3S: Supplier Part: C9900198004; Supplier Footprint: SMD; Supplier: LCSC; supplier: LCSC; supplierId: C9900198004

## Nets
3V3: C6.1 C16.1 C17.1 C18.1 C19.1 C21.1 C23.1 C24.2 C25.2 C26.2 C27.2 C31.1 CN1.1 L2.2 R1.1 R7.1 R10.2 R11.1 R12.2 R13.2 R14.1 R15.1 R17.1 R19.1 U3.4(VBAT) U3.5(VREF+) U3.6(VDDA/DDA) U4.8(VCC) U5.8(3V3) U7.1
12V_PROT: C1.1 C2.1 C9.1 C10.1 C11.2 C14.2 C22.1 D1.1(K) F1.2 R3.2 U1.2(VIN) U1.9(EN) U1.10(VIN) U2.1(VM) U2.8(VM)
GND: C1.2 C2.2 C3.2 C6.2 C7.1 C8.1 C9.2 C10.2 C11.1 C12.2 C15.2 C16.2 C17.2 C18.2 C19.2 C20.2 C21.2 C22.2 C23.2 C24.1 C25.1 C26.1 C27.1 C28.1 C29.1 C30.1 C31.2 CN1.2 CN1.9 CN1.10 D1.2(A) DC1.3 DC1.4 LED1.1(K) LED2.1(K) Q2.2(S) R2.2 R5.2 R8.2 R9.2 R16.2 SW2.1 SW2.2 U1.1(PGND) U1.6(AGND) U1.11(PGND) U2.2(PGND) U2.7(PGND) U2.9(GND) U2.14(STL_REP) U2.16(STL_MODE) U2.25(EP) U3.7(VSSA/SSA) U4.4(GND) U4.7(WP) U5.9(GND) U6.1 U6.3 U6.5 U6.6 U7.2 U7.5 U7.6 X1.2(GND) X1.4(GND)
DEBUG_RX: CN1.5 U3.14(PA3)
DEBUG_TX: CN1.4 U3.13(PA2)
DRV_DIR: U2.19(DIR) U3.18(PA7)
DRV_DVDD: C12.1 R4.1 U2.10(DVDD) U2.13(M0) U2.17(M1)
DRV_ENABLE: R8.1 U2.20(ENABLE) U3.19(PB0)
DRV_NFAULT: R7.2 U2.11(nFAULT) U3.21(PB2)
DRV_NSLEEP: R9.1 U2.21(nSLEEP) U3.20(PB1)
DRV_STEP: U2.18(STEP) U3.17(PA6)
DRV_TRQ_CNT: C15.1 U2.15(TRQ_CNT/STL_TH) U3.11(PA0)
EEPROM_IIC_SCL: R12.1 U3.45(PB6) U4.6(SCL)
EEPROM_IIC_SDA: R13.1 U3.46(PB7) U4.5(SDA)
EXT_SENSOR_ADC: U3.22(PB10) U7.3
EXT_SENSOR_DIG: U3.23(PB11) U7.4
KEY_DOWN: C28.2 R11.2 U3.31(PC7) U6.4
KEY_UP: C20.1 R10.1 U3.30(PC6) U6.2
LED_STATUS: LED3.1(K) U3.24(PB12)
LOW_CURRENT_SEL: Q2.1(G) R16.1 U3.15(PA4)
MCU_NRST: C29.2 CN1.3 R14.2 U3.10(NRST)
NETCONTROL_BTN: C30.2 R17.2 SW2.4 U3.1(PC13)
SW: C4.2 L2.1 U1.3(NC) U1.12(SW)
SWCLK: CN1.7 U3.36(PA14-BOOT0)
SWDIO: CN1.6 U3.35(PA13)
TUYA_CEN: CN1.8 U5.3(CEN)
TUYA_UART_RX: U3.32(PA10) U5.16(TX1)
TUYA_UART_TX: U3.29(PA9) U5.15(RX1)
$1N1384: DC1.5 F1.1
$1N1510: C3.1 U1.5(VCC)
$1N1519: C4.1 U1.4(BOOT)
$1N1616: R1.2 R2.1 U1.7(FB)
$1N1778: LED1.2(A) R3.1
$1N1782: LED2.2(A) R19.2
$2N1305: CN2.1 U2.3(AOUT1)
$2N1308: CN2.2 U2.4(AOUT2)
$2N1311: CN2.3 U2.5(BOUT2)
$2N1314: CN2.4 U2.6(BOUT1)
$2N1397: R4.2 R5.1 R6.1 U2.12(VREF)
$2N1423: Q2.3(D) R6.2
$2N1428: C13.2 U2.23(CPH)
$2N1433: C13.1 U2.22(CPL)
$2N1438: C14.1 U2.24(VCP)
$3N1969: C7.2 U3.8(PF0-OSC_IN) X1.3
$3N1970: C8.2 U3.9(PF1-OSC_OUT) X1.1
$4N1127: LED3.2(A) R15.2

Not connected (* = marked no-connect by the designer): SW2 3*; U1 8(PG)*; U3 2(PC14-OSC32_IN)* 3(PC15-OSC32_OUT)* 12(PA1)* 16(PA5)* 25(PB13)* 26(PB14)* 27(PB15)* 28(PA8)* 33(PA11[PA9])* 34(PA12[PA10])* 37(PA15)* 38(PD0)* 39(PD1)* 40(PD2)* 41(PD3)* 42(PB3)* 43(PB4)* 44(PB5)* 47(PB8)* 48(PB9)*; U4 1(NC)* 2(NC)* 3(NC)*; U5 1(RST)* 2(ADC3)* 4(P22)* 5(P6)* 6(P8)* 7(P9)* 10(P23)* 11(TX2)* 12(RX2)* 13(P24)* 14(P26)* 17* 18* 19* 20* 21* 22*
